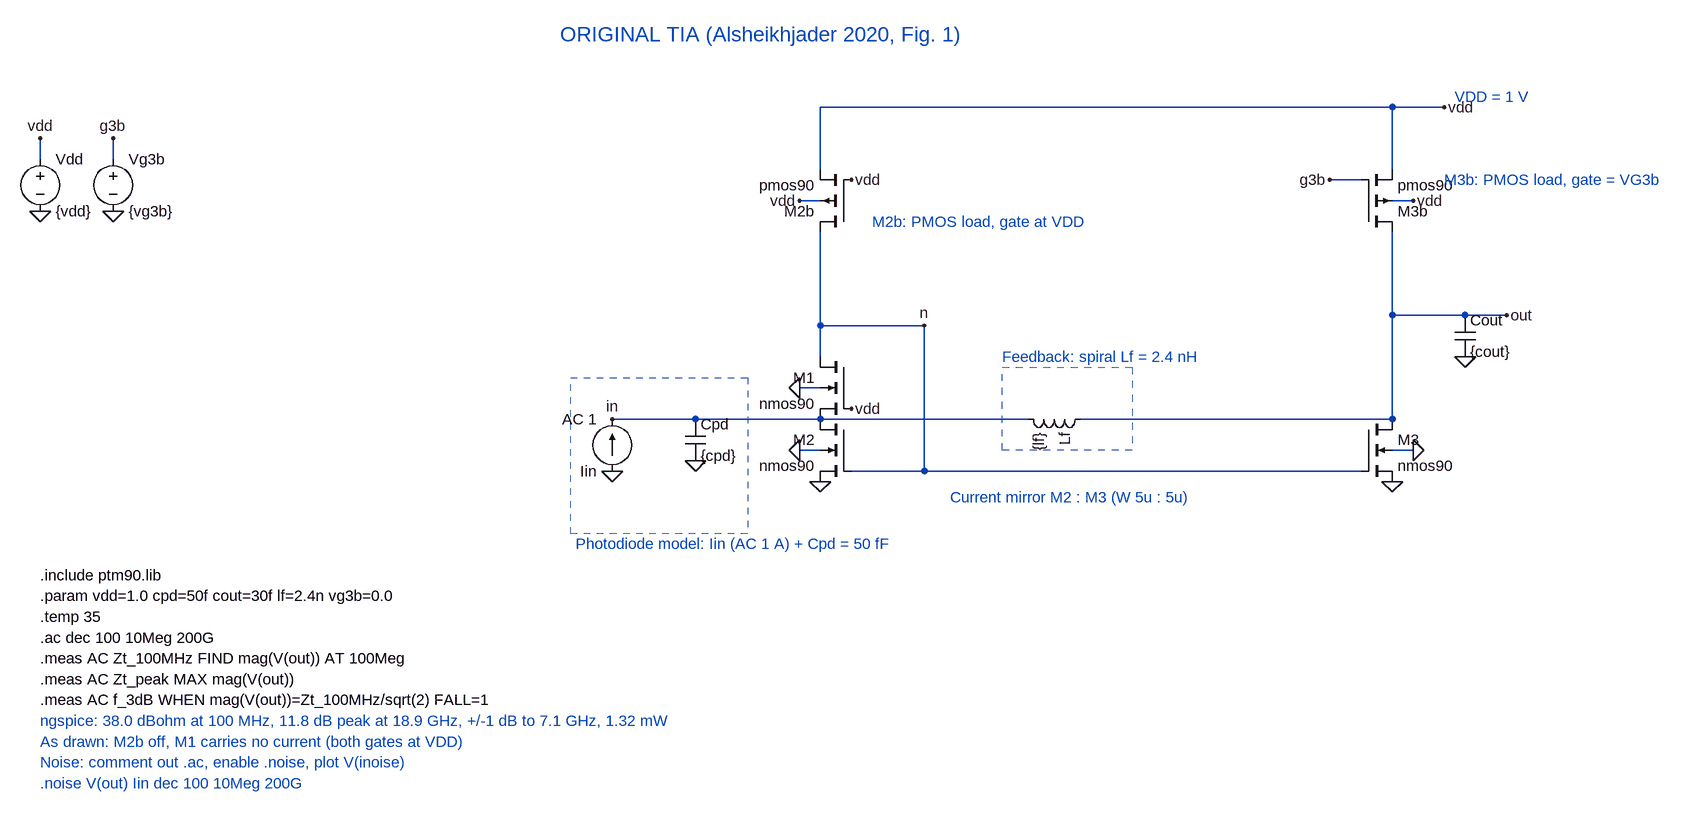
[diagram p0: schematic 1_original_tia.asc]
1_original_tia.asc, the LTspice schematic file:
Version 4.1
SHEET 1 3200 2000
WIRE 1200 0 320 0
WIRE 1280 0 1200 0
WIRE -880 80 -880 48
WIRE -768 80 -768 48
WIRE 320 96 320 0
WIRE 1200 96 1200 0
WIRE 1152 112 1104 112
WIRE 320 144 288 144
WIRE 1232 144 1200 144
WIRE 1200 320 1200 192
WIRE 1312 320 1200 320
WIRE 1376 320 1312 320
WIRE 320 336 320 192
WIRE 480 336 320 336
WIRE 320 384 320 336
WIRE 320 432 288 432
WIRE 128 480 0 480
WIRE 320 480 128 480
WIRE 640 480 320 480
WIRE 1200 480 1200 320
WIRE 1200 480 720 480
WIRE 320 528 288 528
WIRE 1232 528 1200 528
WIRE 480 560 480 336
WIRE 480 560 368 560
WIRE 1152 560 480 560
FLAG 0 560 0
FLAG 0 480 in
FLAG 128 544 0
FLAG 288 528 0
FLAG 320 576 0
FLAG 1232 528 0
FLAG 1200 576 0
FLAG 480 336 n
FLAG 1312 384 0
FLAG 1376 320 out
FLAG 1280 0 vdd
FLAG 288 144 vdd
FLAG 368 112 vdd
FLAG 368 464 vdd
FLAG 288 432 0
FLAG 1232 144 vdd
FLAG 1104 112 g3b
FLAG -880 48 vdd
FLAG -880 160 0
FLAG -768 48 g3b
FLAG -768 160 0
SYMBOL current 0 560 R180
SYMATTR InstName Iin
SYMATTR Value AC 1
SYMBOL cap 112 480 R0
SYMATTR InstName Cpd
SYMATTR Value {cpd}
SYMBOL nmos4 368 480 M0
SYMATTR InstName M2
SYMATTR Value nmos90
SYMATTR Value2 l=90n w=5u ad=1p as=1p pd=10.4u ps=10.4u
SYMBOL nmos4 368 384 M0
SYMATTR InstName M1
SYMATTR Value nmos90
SYMATTR Value2 l=90n w=5u ad=1p as=1p pd=10.4u ps=10.4u
SYMBOL nmos4 1152 480 R0
SYMATTR InstName M3
SYMATTR Value nmos90
SYMATTR Value2 l=90n w=5u ad=1p as=1p pd=10.4u ps=10.4u
SYMBOL cap 1296 320 R0
SYMATTR InstName Cout
SYMATTR Value {cout}
SYMBOL pmos4 368 192 R180
SYMATTR InstName M2b
SYMATTR Value pmos90
SYMATTR Value2 l=90n w=0.9u ad=0.18p as=0.18p pd=2.2u ps=2.2u
SYMBOL pmos4 1152 192 M180
SYMATTR InstName M3b
SYMATTR Value pmos90
SYMATTR Value2 l=90n w=5u ad=1p as=1p pd=10.4u ps=10.4u
SYMBOL ind 736 464 R90
SYMATTR InstName Lf
SYMATTR Value {lf}
SYMBOL voltage -880 64 R0
SYMATTR InstName Vdd
SYMATTR Value {vdd}
SYMBOL voltage -768 64 R0
SYMATTR InstName Vg3b
SYMATTR Value {vg3b}
TEXT 1296 -16 Left 2 ;VDD = 1 V
TEXT -56 672 Left 2 ;Photodiode model: Iin (AC 1 A) + Cpd = 50 fF
TEXT 600 384 Left 2 ;Feedback: spiral Lf = 2.4 nH
TEXT 400 176 Left 2 ;M2b: PMOS load, gate at VDD
TEXT 1280 112 Left 2 ;M3b: PMOS load, gate = VG3b
TEXT 520 600 Left 2 ;Current mirror M2 : M3 (W 5u : 5u)
TEXT -80 -112 Left 3 ;ORIGINAL TIA (Alsheikhjader 2020, Fig. 1)
TEXT -880 720 Left 2 !.include ptm90.lib
TEXT -880 752 Left 2 !.param vdd=1.0 cpd=50f cout=30f lf=2.4n vg3b=0.0
TEXT -880 784 Left 2 !.temp 35
TEXT -880 816 Left 2 !.ac dec 100 10Meg 200G
TEXT -880 848 Left 2 !.meas AC Zt_100MHz FIND mag(V(out)) AT 100Meg
TEXT -880 880 Left 2 !.meas AC Zt_peak MAX mag(V(out))
TEXT -880 912 Left 2 !.meas AC f_3dB WHEN mag(V(out))=Zt_100MHz/sqrt(2) FALL=1
TEXT -880 944 Left 2 ;ngspice: 38.0 dBohm at 100 MHz, 11.8 dB peak at 18.9 GHz, +/-1 dB to 7.1 GHz, 1.32 mW
TEXT -880 976 Left 2 ;As drawn: M2b off, M1 carries no current (both gates at VDD)
TEXT -880 1008 Left 2 ;Noise: comment out .ac, enable .noise, plot V(inoise)
TEXT -880 1040 Left 2 ;.noise V(out) Iin dec 100 10Meg 200G
RECTANGLE Normal -64 416 208 656 1
RECTANGLE Normal 600 400 800 528 2

The netlist it stands for:
* 1_original_tia.asc
Iin 0 in AC 1
Cpd in 0 {cpd}
M2 in n 0 0 nmos90 l=90n w=5u ad=1p as=1p pd=10.4u ps=10.4u
M1 n vdd in 0 nmos90 l=90n w=5u ad=1p as=1p pd=10.4u ps=10.4u
M3 out n 0 0 nmos90 l=90n w=5u ad=1p as=1p pd=10.4u ps=10.4u
Cout out 0 {cout}
M2b n vdd vdd vdd pmos90 l=90n w=0.9u ad=0.18p as=0.18p pd=2.2u ps=2.2u
M3b out g3b vdd vdd pmos90 l=90n w=5u ad=1p as=1p pd=10.4u ps=10.4u
Lf out in {lf}
Vdd vdd 0 {vdd}
Vg3b g3b 0 {vg3b}
.model NMOS NMOS
.model PMOS PMOS
.lib standard.mos
* VDD = 1 V
* Photodiode model: Iin (AC 1 A) + Cpd = 50 fF
* Feedback: spiral Lf = 2.4 nH
* M2b: PMOS load, gate at VDD
* M3b: PMOS load, gate = VG3b
* Current mirror M2 : M3 (W 5u : 5u)
* ORIGINAL TIA (Alsheikhjader 2020, Fig. 1)
.include ptm90.lib
.param vdd=1.0 cpd=50f cout=30f lf=2.4n vg3b=0.0
.temp 35
.ac dec 100 10Meg 200G
.meas AC Zt_100MHz FIND mag(V(out)) AT 100Meg
.meas AC Zt_peak MAX mag(V(out))
.meas AC f_3dB WHEN mag(V(out))=Zt_100MHz/sqrt(2) FALL=1
* ngspice: 38.0 dBohm at 100 MHz, 11.8 dB peak at 18.9 GHz, +/-1 dB to 7.1 GHz, 1.32 mW
* As drawn: M2b off, M1 carries no current (both gates at VDD)
* Noise: comment out .ac, enable .noise, plot V(inoise)
* .noise V(out) Iin dec 100 10Meg 200G
.backanno
.end

* Results of the author's LTspice run, read from the files saved beside the schematic
* Operating Point, zero values left out:
*   V(in) = 496 mV
*   V(n) = 496 mV
*   V(out) = 496 mV
*   V(vdd) = 1 V
*   I(Lf) = 661 µA
*   I(Vdd) = -1.322 mA
*   I(Vg3b) = 20.4 pA
*   Ib(M2) = -1.415 pA
*   Ib(M3) = -1.415 pA
*   Ib(M3b) = 1.636 pA
*   Id(M1) = 4.673 nA
*   Id(M2) = 661 µA
*   Id(M2b) = -4.151 nA
*   Id(M3) = 661 µA
*   Id(M3b) = -1.322 mA
*   Ig(M1) = 310.8 pA
*   Ig(M2) = 189 pA
*   Ig(M3) = 189 pA
*   Ig(M3b) = -20.4 pA
*   Is(M1) = -4.983 nA
*   Is(M2) = -661 µA
*   Is(M2b) = 4.15 nA
*   Is(M3) = -661 µA
*   Is(M3b) = 1.322 mA
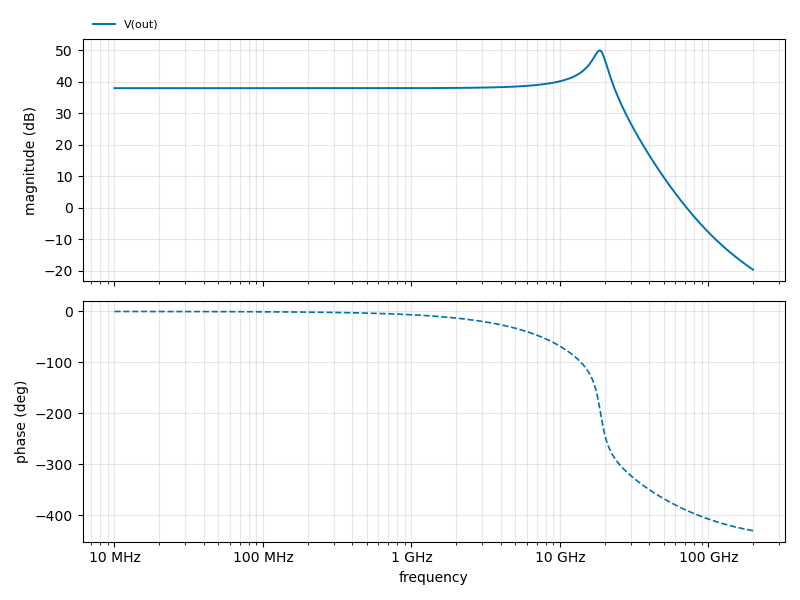
[diagram p1: AC Analysis of 1_original_tia.asc, plotted from the saved traces]
* AC Analysis, 1 run:
*   V(out): 38.00 dB at 10 MHz, -19.60 dB at 200 GHz, peak 49.99 dB at 18.62 GHz, 3 dB below the peak at 16.57 GHz and 20.08 GHz